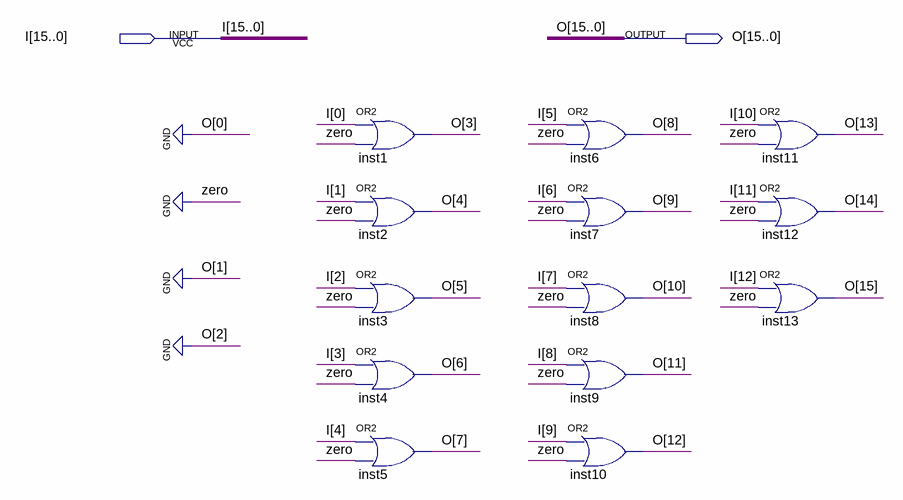
[diagram p0: schematic sheet]
// Quartus schematic shift_left_3.bdf as structural Verilog: 13 symbols, 2 pins
module shift_left_3 (
  input  [15:0] I,
  output [15:0] O
);

  or inst1 (O[3], I[0], 1'b0);
  or inst2 (O[4], I[1], 1'b0);
  or inst3 (O[5], I[2], 1'b0);
  or inst4 (O[6], I[3], 1'b0);
  or inst5 (O[7], I[4], 1'b0);
  or inst6 (O[8], I[5], 1'b0);
  or inst7 (O[9], I[6], 1'b0);
  or inst8 (O[10], I[7], 1'b0);
  or inst9 (O[11], I[8], 1'b0);
  or inst10 (O[12], I[9], 1'b0);
  or inst11 (O[13], I[10], 1'b0);
  or inst12 (O[14], I[11], 1'b0);
  or inst13 (O[15], I[12], 1'b0);

  assign O[2:0] = 3'b000;
endmodule
